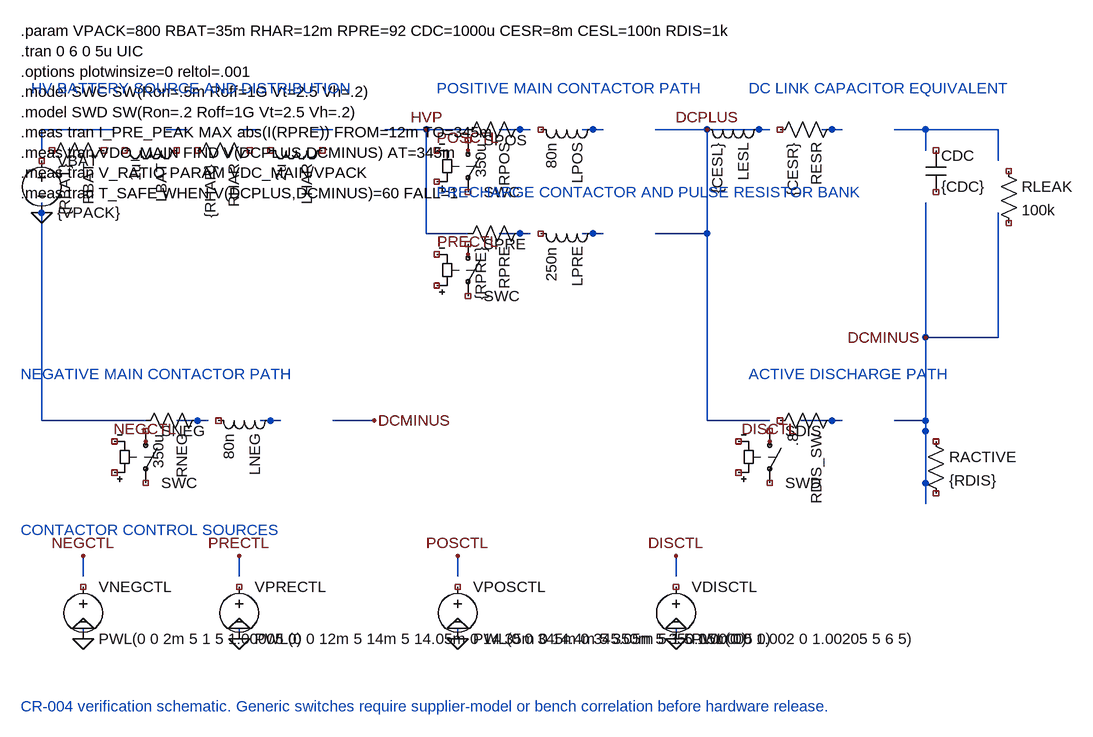
[diagram p0: schematic 800V_DCLink_CR004_Complete.asc]
800V_DCLink_CR004_Complete.asc, the LTspice schematic file:
Version 4
SHEET 1 1800 1200
TEXT 64 40 Left 2 !.param VPACK=800 RBAT=35m RHAR=12m RPRE=92 CDC=1000u CESR=8m CESL=100n RDIS=1k\n.tran 0 6 0 5u UIC\n.options plotwinsize=0 reltol=.001\n.model SWC SW(Ron=.5m Roff=1G Vt=2.5 Vh=.2)\n.model SWD SW(Ron=.2 Roff=1G Vt=2.5 Vh=.2)\n.meas tran I_PRE_PEAK MAX abs(I(RPRE)) FROM=12m TO=345m\n.meas tran VDC_MAIN FIND V(DCPLUS,DCMINUS) AT=345m\n.meas tran V_RATIO PARAM VDC_MAIN/VPACK\n.meas tran T_SAFE WHEN V(DCPLUS,DCMINUS)=60 FALL=1
TEXT 80 128 Left 2 ;HV BATTERY SOURCE AND DISTRIBUTION
SYMBOL voltage 96 224 R0
SYMATTR InstName VBAT
SYMATTR Value {VPACK}
SYMBOL res 208 208 R90
SYMATTR InstName RBAT
SYMATTR Value {RBAT}
SYMBOL ind 320 208 R90
SYMATTR InstName LBAT
SYMATTR Value 1u
SYMBOL res 432 208 R90
SYMATTR InstName RHAR
SYMATTR Value {RHAR}
SYMBOL ind 544 208 R90
SYMATTR InstName LHAR
SYMATTR Value 2u
FLAG 96 320 0
WIRE 96 224 96 192
WIRE 96 192 208 192
WIRE 288 192 320 192
WIRE 400 192 432 192
WIRE 512 192 544 192
WIRE 624 192 688 192
FLAG 688 192 HVP
WIRE 96 304 96 320

TEXT 704 128 Left 2 ;POSITIVE MAIN CONTACTOR PATH
SYMBOL sw 752 192 R0
SYMATTR InstName SPOS
SYMATTR Value SWC
SYMBOL res 848 176 R90
SYMATTR InstName RPOS
SYMATTR Value 350u
SYMBOL ind 960 176 R90
SYMATTR InstName LPOS
SYMATTR Value 80n
WIRE 688 192 752 192
WIRE 800 192 848 192
WIRE 928 192 960 192
WIRE 1040 192 1120 192
FLAG 1120 192 DCPLUS

TEXT 704 288 Left 2 ;PRECHARGE CONTACTOR AND PULSE RESISTOR BANK
SYMBOL sw 752 352 R0
SYMATTR InstName SPRE
SYMATTR Value SWC
SYMBOL res 848 336 R90
SYMATTR InstName RPRE
SYMATTR Value {RPRE}
SYMBOL ind 960 336 R90
SYMATTR InstName LPRE
SYMATTR Value 250n
WIRE 688 192 688 352
WIRE 688 352 752 352
WIRE 800 352 848 352
WIRE 928 352 960 352
WIRE 1040 352 1120 352
WIRE 1120 352 1120 192

TEXT 1184 128 Left 2 ;DC LINK CAPACITOR EQUIVALENT
SYMBOL ind 1216 176 R90
SYMATTR InstName LESL
SYMATTR Value {CESL}
SYMBOL res 1328 176 R90
SYMATTR InstName RESR
SYMATTR Value {CESR}
SYMBOL cap 1456 224 R0
SYMATTR InstName CDC
SYMATTR Value {CDC}
SYMATTR SpiceLine IC=0
WIRE 1120 192 1216 192
WIRE 1296 192 1328 192
WIRE 1408 192 1456 192
WIRE 1456 192 1456 224
WIRE 1456 304 1456 512
FLAG 1456 512 DCMINUS
SYMBOL res 1568 240 R0
SYMATTR InstName RLEAK
SYMATTR Value 100k
WIRE 1456 192 1568 192
WIRE 1568 192 1568 240
WIRE 1568 320 1568 512
WIRE 1456 512 1568 512

TEXT 1184 568 Left 2 ;ACTIVE DISCHARGE PATH
SYMBOL sw 1216 640 R0
SYMATTR InstName SDIS
SYMATTR Value SWD
SYMBOL res 1328 624 R90
SYMATTR InstName RDIS_SW
SYMATTR Value .8
SYMBOL res 1456 656 R0
SYMATTR InstName RACTIVE
SYMATTR Value {RDIS}
WIRE 1120 192 1120 640
WIRE 1120 640 1216 640
WIRE 1264 640 1328 640
WIRE 1408 640 1456 640
WIRE 1456 640 1456 656
WIRE 1456 736 1456 768
WIRE 1456 768 1456 512

TEXT 64 568 Left 2 ;NEGATIVE MAIN CONTACTOR PATH
SYMBOL sw 256 640 R0
SYMATTR InstName SNEG
SYMATTR Value SWC
SYMBOL res 352 624 R90
SYMATTR InstName RNEG
SYMATTR Value 350u
SYMBOL ind 464 624 R90
SYMATTR InstName LNEG
SYMATTR Value 80n
WIRE 96 320 96 640
WIRE 96 640 256 640
WIRE 304 640 352 640
WIRE 432 640 464 640
WIRE 544 640 608 640
FLAG 608 640 DCMINUS

TEXT 64 808 Left 2 ;CONTACTOR CONTROL SOURCES
SYMBOL voltage 160 880 R0
SYMATTR InstName VNEGCTL
SYMATTR Value PWL(0 0 2m 5 1 5 1.00005 0)
SYMBOL voltage 400 880 R0
SYMATTR InstName VPRECTL
SYMATTR Value PWL(0 0 12m 5 14m 5 14.05m 0 14.35m 0 14.4m 5 350m 5 350.05m 0)
SYMBOL voltage 736 880 R0
SYMATTR InstName VPOSCTL
SYMATTR Value PWL(0 0 345m 0 345.05m 5 1 5 1.00005 0)
SYMBOL voltage 1072 880 R0
SYMATTR InstName VDISCTL
SYMATTR Value PWL(0 0 1.002 0 1.00205 5 6 5)
FLAG 160 960 0
FLAG 400 960 0
FLAG 736 960 0
FLAG 1072 960 0
FLAG 160 848 NEGCTL
FLAG 400 848 PRECTL
FLAG 736 848 POSCTL
FLAG 1072 848 DISCTL
WIRE 160 848 160 880
WIRE 160 960 160 976
WIRE 400 848 400 880
WIRE 400 960 400 976
WIRE 736 848 736 880
WIRE 736 960 736 976
WIRE 1072 848 1072 880
WIRE 1072 960 1072 976
FLAG 160 976 0
FLAG 400 976 0
FLAG 736 976 0
FLAG 1072 976 0

FLAG 752 224 POSCTL
FLAG 752 384 PRECTL
FLAG 256 672 NEGCTL
FLAG 1216 672 DISCTL
TEXT 64 1080 Left 2 ;CR-004 verification schematic. Generic switches require supplier-model or bench correlation before hardware release.

The netlist it stands for:
* 800V_DCLink_CR004_Complete.asc
VBAT NC_01 0 {VPACK}
RBAT NC_02 NC_03 {RBAT}
LBAT NC_04 NC_05 1u
RHAR NC_06 NC_07 {RHAR}
LHAR NC_08 NC_09 2u
* SPOS: SWC (symbol sw not certain, pin order unknown); nets seen at it: 
RPOS N005 HVP 350u
LPOS N006 NC_14 80n
* SPRE: SWC (symbol sw not certain, pin order unknown); nets seen at it: 
RPRE N007 HVP {RPRE}
LPRE N008 NC_19 250n
LESL DCPLUS DCPLUS {CESL}
RESR N009 NC_20 {CESR}
CDC NC_21 NC_22 {CDC} IC=0
RLEAK NC_23 NC_24 100k
* SDIS: SWD (symbol sw not certain, pin order unknown); nets seen at it: 
RDIS_SW N011 NC_29 .8
RACTIVE NC_30 NC_31 {RDIS}
* SNEG: SWC (symbol sw not certain, pin order unknown); nets seen at it: 
RNEG N012 0 350u
LNEG N013 NC_36 80n
VNEGCTL NC_37 0 PWL(0 0 2m 5 1 5 1.00005 0)
VPRECTL NC_38 0 PWL(0 0 12m 5 14m 5 14.05m 0 14.35m 0 14.4m 5 350m 5 350.05m 0)
VPOSCTL NC_39 0 PWL(0 0 345m 0 345.05m 5 1 5 1.00005 0)
VDISCTL NC_40 0 PWL(0 0 1.002 0 1.00205 5 6 5)
.param VPACK=800 RBAT=35m RHAR=12m RPRE=92 CDC=1000u CESR=8m CESL=100n RDIS=1k
.tran 0 6 0 5u UIC
.options plotwinsize=0 reltol=.001
.model SWC SW(Ron=.5m Roff=1G Vt=2.5 Vh=.2)
.model SWD SW(Ron=.2 Roff=1G Vt=2.5 Vh=.2)
.meas tran I_PRE_PEAK MAX abs(I(RPRE)) FROM=12m TO=345m
.meas tran VDC_MAIN FIND V(DCPLUS,DCMINUS) AT=345m
.meas tran V_RATIO PARAM VDC_MAIN/VPACK
.meas tran T_SAFE WHEN V(DCPLUS,DCMINUS)=60 FALL=1
* HV BATTERY SOURCE AND DISTRIBUTION
* POSITIVE MAIN CONTACTOR PATH
* PRECHARGE CONTACTOR AND PULSE RESISTOR BANK
* DC LINK CAPACITOR EQUIVALENT
* ACTIVE DISCHARGE PATH
* NEGATIVE MAIN CONTACTOR PATH
* CONTACTOR CONTROL SOURCES
* CR-004 verification schematic. Generic switches require supplier-model or bench correlation before hardware release.
.backanno
.end